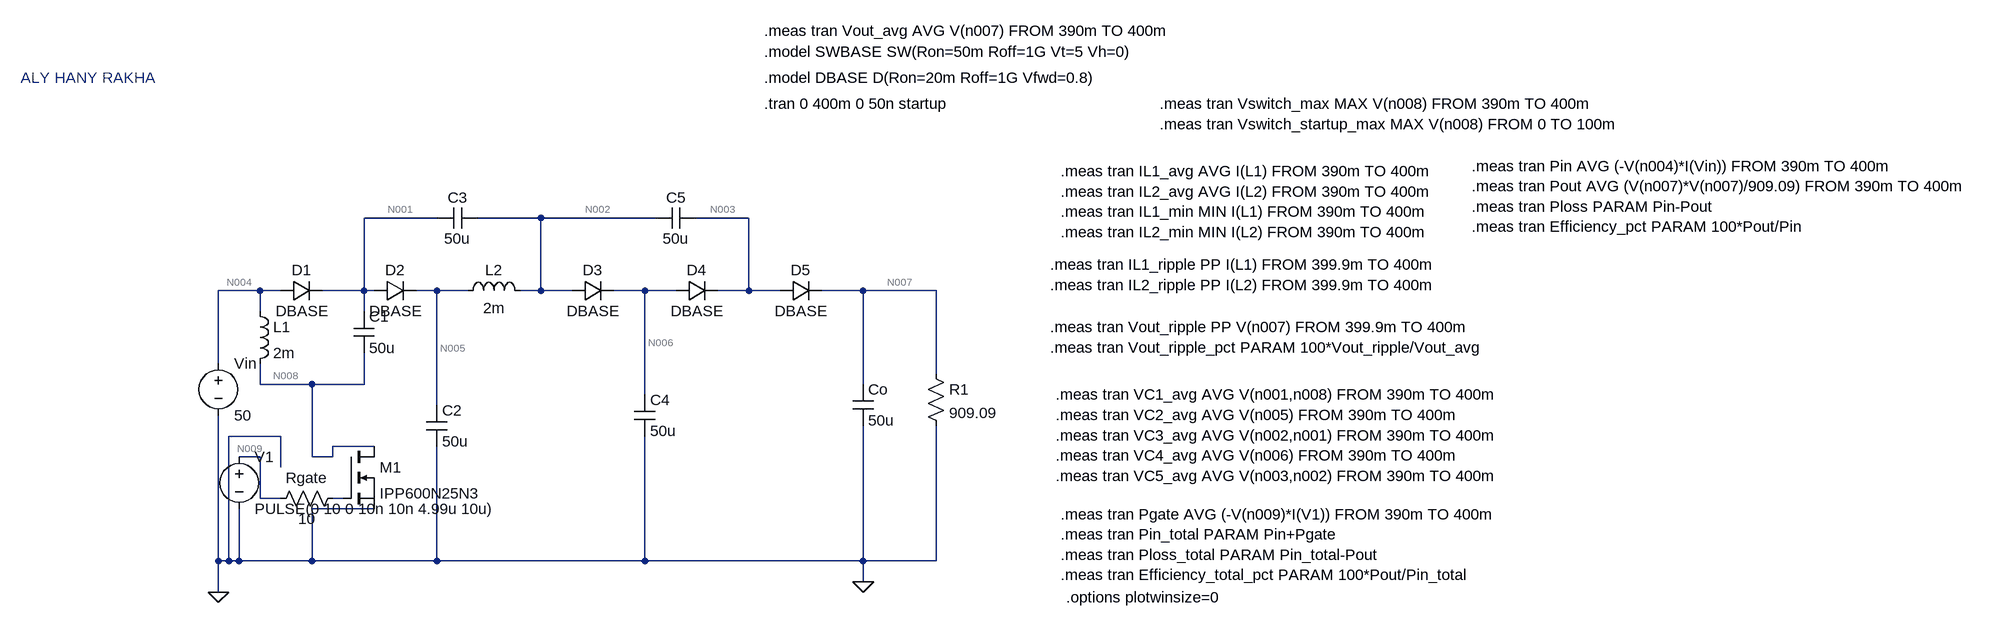
[diagram p0: schematic P08_mosfet_check.asc]
P08_mosfet_check.asc, the LTspice schematic file:
Version 4.1
SHEET 1 2768 680
WIRE 352 -128 240 -128
WIRE 512 -128 416 -128
WIRE 688 -128 512 -128
WIRE 832 -128 752 -128
WIRE 80 -16 16 -16
WIRE 112 -16 80 -16
WIRE 240 -16 240 -128
WIRE 240 -16 176 -16
WIRE 256 -16 240 -16
WIRE 352 -16 320 -16
WIRE 400 -16 352 -16
WIRE 512 -16 512 -128
WIRE 512 -16 480 -16
WIRE 560 -16 512 -16
WIRE 672 -16 624 -16
WIRE 720 -16 672 -16
WIRE 832 -16 832 -128
WIRE 832 -16 784 -16
WIRE 880 -16 832 -16
WIRE 1008 -16 944 -16
WIRE 1120 -16 1008 -16
WIRE 80 16 80 -16
WIRE 240 16 240 -16
WIRE 16 96 16 -16
WIRE 1120 112 1120 -16
WIRE 80 128 80 96
WIRE 160 128 80 128
WIRE 240 128 240 80
WIRE 240 128 160 128
WIRE 1008 128 1008 -16
WIRE 672 144 672 -16
WIRE 352 160 352 -16
WIRE 112 208 32 208
WIRE 256 224 192 224
WIRE 80 240 48 240
WIRE 160 240 160 128
WIRE 192 240 192 224
WIRE 192 240 160 240
WIRE 112 256 112 208
WIRE 80 304 80 240
WIRE 112 304 80 304
WIRE 208 304 192 304
WIRE 256 320 160 320
WIRE 16 400 16 176
WIRE 32 400 32 208
WIRE 32 400 16 400
WIRE 48 400 48 320
WIRE 48 400 32 400
WIRE 160 400 160 320
WIRE 160 400 48 400
WIRE 352 400 352 224
WIRE 352 400 160 400
WIRE 672 400 672 208
WIRE 672 400 352 400
WIRE 1008 400 1008 192
WIRE 1008 400 672 400
WIRE 1120 400 1120 192
WIRE 1120 400 1008 400
WIRE 1008 432 1008 400
WIRE 16 448 16 400
FLAG 16 448 0
FLAG 1008 432 0
SYMBOL voltage 16 80 R0
WINDOW 123 0 0 Left 0
WINDOW 39 0 0 Left 0
SYMATTR InstName Vin
SYMATTR Value 50
SYMBOL diode 112 0 R270
WINDOW 0 32 32 VTop 2
WINDOW 3 0 32 VBottom 2
SYMATTR InstName D1
SYMATTR Value DBASE
SYMBOL diode 256 0 R270
WINDOW 0 32 32 VTop 2
WINDOW 3 0 32 VBottom 2
SYMATTR InstName D2
SYMATTR Value DBASE
SYMBOL ind 64 0 R0
SYMATTR InstName L1
SYMATTR Value 2m
SYMATTR SpiceLine Rser=100m
SYMBOL ind 384 0 R270
WINDOW 0 32 56 VTop 2
WINDOW 3 5 56 VBottom 2
SYMATTR InstName L2
SYMATTR Value 2m
SYMATTR SpiceLine Rser=100m
SYMBOL diode 560 0 R270
WINDOW 0 32 32 VTop 2
WINDOW 3 0 32 VBottom 2
SYMATTR InstName D3
SYMATTR Value DBASE
SYMBOL diode 720 0 R270
WINDOW 0 32 32 VTop 2
WINDOW 3 0 32 VBottom 2
SYMATTR InstName D4
SYMATTR Value DBASE
SYMBOL diode 880 0 R270
WINDOW 0 32 32 VTop 2
WINDOW 3 0 32 VBottom 2
SYMATTR InstName D5
SYMATTR Value DBASE
SYMBOL cap 224 16 R0
SYMATTR InstName C1
SYMATTR Value 50u
SYMATTR SpiceLine Rser=50m
SYMBOL cap 336 160 R0
SYMATTR InstName C2
SYMATTR Value 50u
SYMATTR SpiceLine Rser=50m
SYMBOL cap 352 -112 R270
WINDOW 0 32 32 VTop 2
WINDOW 3 0 32 VBottom 2
SYMATTR InstName C3
SYMATTR Value 50u
SYMATTR SpiceLine Rser=50m
SYMBOL cap 656 144 R0
SYMATTR InstName C4
SYMATTR Value 50u
SYMATTR SpiceLine Rser=50m
SYMBOL cap 752 -144 R90
WINDOW 0 0 32 VBottom 2
WINDOW 3 32 32 VTop 2
SYMATTR InstName C5
SYMATTR Value 50u
SYMATTR SpiceLine Rser=50m
SYMBOL cap 992 128 R0
SYMATTR InstName Co
SYMATTR Value 50u
SYMATTR SpiceLine Rser=50m
SYMBOL res 1104 96 R0
SYMATTR InstName R1
SYMATTR Value 909.09
SYMBOL voltage 48 224 R0
WINDOW 123 0 0 Left 0
WINDOW 39 0 0 Left 0
SYMATTR InstName V1
SYMATTR Value PULSE(0 10 0 10n 10n 4.99u 10u)
SYMBOL nmos 208 224 R0
SYMATTR InstName M1
SYMATTR Value IPP600N25N3
SYMBOL res 208 288 R90
WINDOW 0 0 56 VBottom 2
WINDOW 3 32 56 VTop 2
SYMATTR InstName Rgate
SYMATTR Value 10
TEXT 856 -384 Left 2 !.model SWBASE SW(Ron=50m Roff=1G Vt=5 Vh=0)
TEXT 856 -344 Left 2 !.model DBASE D(Ron=20m Roff=1G Vfwd=0.8)
TEXT 856 -304 Left 2 !.tran 0 400m 0 50n startup
TEXT 856 -416 Left 2 !.meas tran Vout_avg AVG V(n007) FROM 390m TO 400m
TEXT 1312 -200 Left 2 !.meas tran IL1_avg AVG I(L1) FROM 390m TO 400m\n.meas tran IL2_avg AVG I(L2) FROM 390m TO 400m\n.meas tran IL1_min MIN I(L1) FROM 390m TO 400m\n.meas tran IL2_min MIN I(L2) FROM 390m TO 400m
TEXT -288 -344 Left 2 ;ALY HANY RAKHA
TEXT 1296 -56 Left 2 !.meas tran IL1_ripple PP I(L1) FROM 399.9m TO 400m\n.meas tran IL2_ripple PP I(L2) FROM 399.9m TO 400m
TEXT 1296 40 Left 2 !.meas tran Vout_ripple PP V(n007) FROM 399.9m TO 400m\n.meas tran Vout_ripple_pct PARAM 100*Vout_ripple/Vout_avg
TEXT 1304 144 Left 2 !.meas tran VC1_avg AVG V(n001,n008) FROM 390m TO 400m\n.meas tran VC2_avg AVG V(n005) FROM 390m TO 400m\n.meas tran VC3_avg AVG V(n002,n001) FROM 390m TO 400m\n.meas tran VC4_avg AVG V(n006) FROM 390m TO 400m\n.meas tran VC5_avg AVG V(n003,n002) FROM 390m TO 400m
TEXT 1464 -304 Left 2 !.meas tran Vswitch_max MAX V(n008) FROM 390m TO 400m\n.meas tran Vswitch_startup_max MAX V(n008) FROM 0 TO 100m
TEXT 1944 -208 Left 2 !.meas tran Pin AVG (-V(n004)*I(Vin)) FROM 390m TO 400m\n.meas tran Pout AVG (V(n007)*V(n007)/909.09) FROM 390m TO 400m\n.meas tran Ploss PARAM Pin-Pout\n.meas tran Efficiency_pct PARAM 100*Pout/Pin
TEXT 1312 328 Left 2 !.meas tran Pgate AVG (-V(n009)*I(V1)) FROM 390m TO 400m\n.meas tran Pin_total PARAM Pin+Pgate\n.meas tran Ploss_total PARAM Pin_total-Pout\n.meas tran Efficiency_total_pct PARAM 100*Pout/Pin_total
TEXT 1320 456 Left 2 !.options plotwinsize=0

The netlist it stands for:
* P08_mosfet_check.asc
Vin N004 0 50
D1 N004 N001 DBASE
D2 N001 N005 DBASE
L1 N004 N008 2m Rser=100m
L2 N005 N002 2m Rser=100m
D3 N002 N006 DBASE
D4 N006 N003 DBASE
D5 N003 N007 DBASE
C1 N001 N008 50u Rser=50m
C2 N005 0 50u Rser=50m
C3 N001 N002 50u Rser=50m
C4 N006 0 50u Rser=50m
C5 N003 N002 50u Rser=50m
Co N007 0 50u Rser=50m
R1 N007 0 909.09
V1 N009 0 PULSE(0 10 0 10n 10n 4.99u 10u)
M1 N008 N010 0 0 IPP600N25N3
Rgate N010 N009 10
.model D D
.lib standard.dio
.model NMOS NMOS
.model PMOS PMOS
.lib standard.mos
.model SWBASE SW(Ron=50m Roff=1G Vt=5 Vh=0)
.model DBASE D(Ron=20m Roff=1G Vfwd=0.8)
.tran 0 400m 0 50n startup
.meas tran Vout_avg AVG V(n007) FROM 390m TO 400m
.meas tran IL1_avg AVG I(L1) FROM 390m TO 400m
.meas tran IL2_avg AVG I(L2) FROM 390m TO 400m
.meas tran IL1_min MIN I(L1) FROM 390m TO 400m
.meas tran IL2_min MIN I(L2) FROM 390m TO 400m
* ALY HANY RAKHA
.meas tran IL1_ripple PP I(L1) FROM 399.9m TO 400m
.meas tran IL2_ripple PP I(L2) FROM 399.9m TO 400m
.meas tran Vout_ripple PP V(n007) FROM 399.9m TO 400m
.meas tran Vout_ripple_pct PARAM 100*Vout_ripple/Vout_avg
.meas tran VC1_avg AVG V(n001,n008) FROM 390m TO 400m
.meas tran VC2_avg AVG V(n005) FROM 390m TO 400m
.meas tran VC3_avg AVG V(n002,n001) FROM 390m TO 400m
.meas tran VC4_avg AVG V(n006) FROM 390m TO 400m
.meas tran VC5_avg AVG V(n003,n002) FROM 390m TO 400m
.meas tran Vswitch_max MAX V(n008) FROM 390m TO 400m
.meas tran Vswitch_startup_max MAX V(n008) FROM 0 TO 100m
.meas tran Pin AVG (-V(n004)*I(Vin)) FROM 390m TO 400m
.meas tran Pout AVG (V(n007)*V(n007)/909.09) FROM 390m TO 400m
.meas tran Ploss PARAM Pin-Pout
.meas tran Efficiency_pct PARAM 100*Pout/Pin
.meas tran Pgate AVG (-V(n009)*I(V1)) FROM 390m TO 400m
.meas tran Pin_total PARAM Pin+Pgate
.meas tran Ploss_total PARAM Pin_total-Pout
.meas tran Efficiency_total_pct PARAM 100*Pout/Pin_total
.options plotwinsize=0
.backanno
.end